# Altium schematic sheet MONO65_A2_s01 [Main page].SchDoc
size A3; DocumentNumber: 1; SheetNumber: 1; SheetTotal: 7
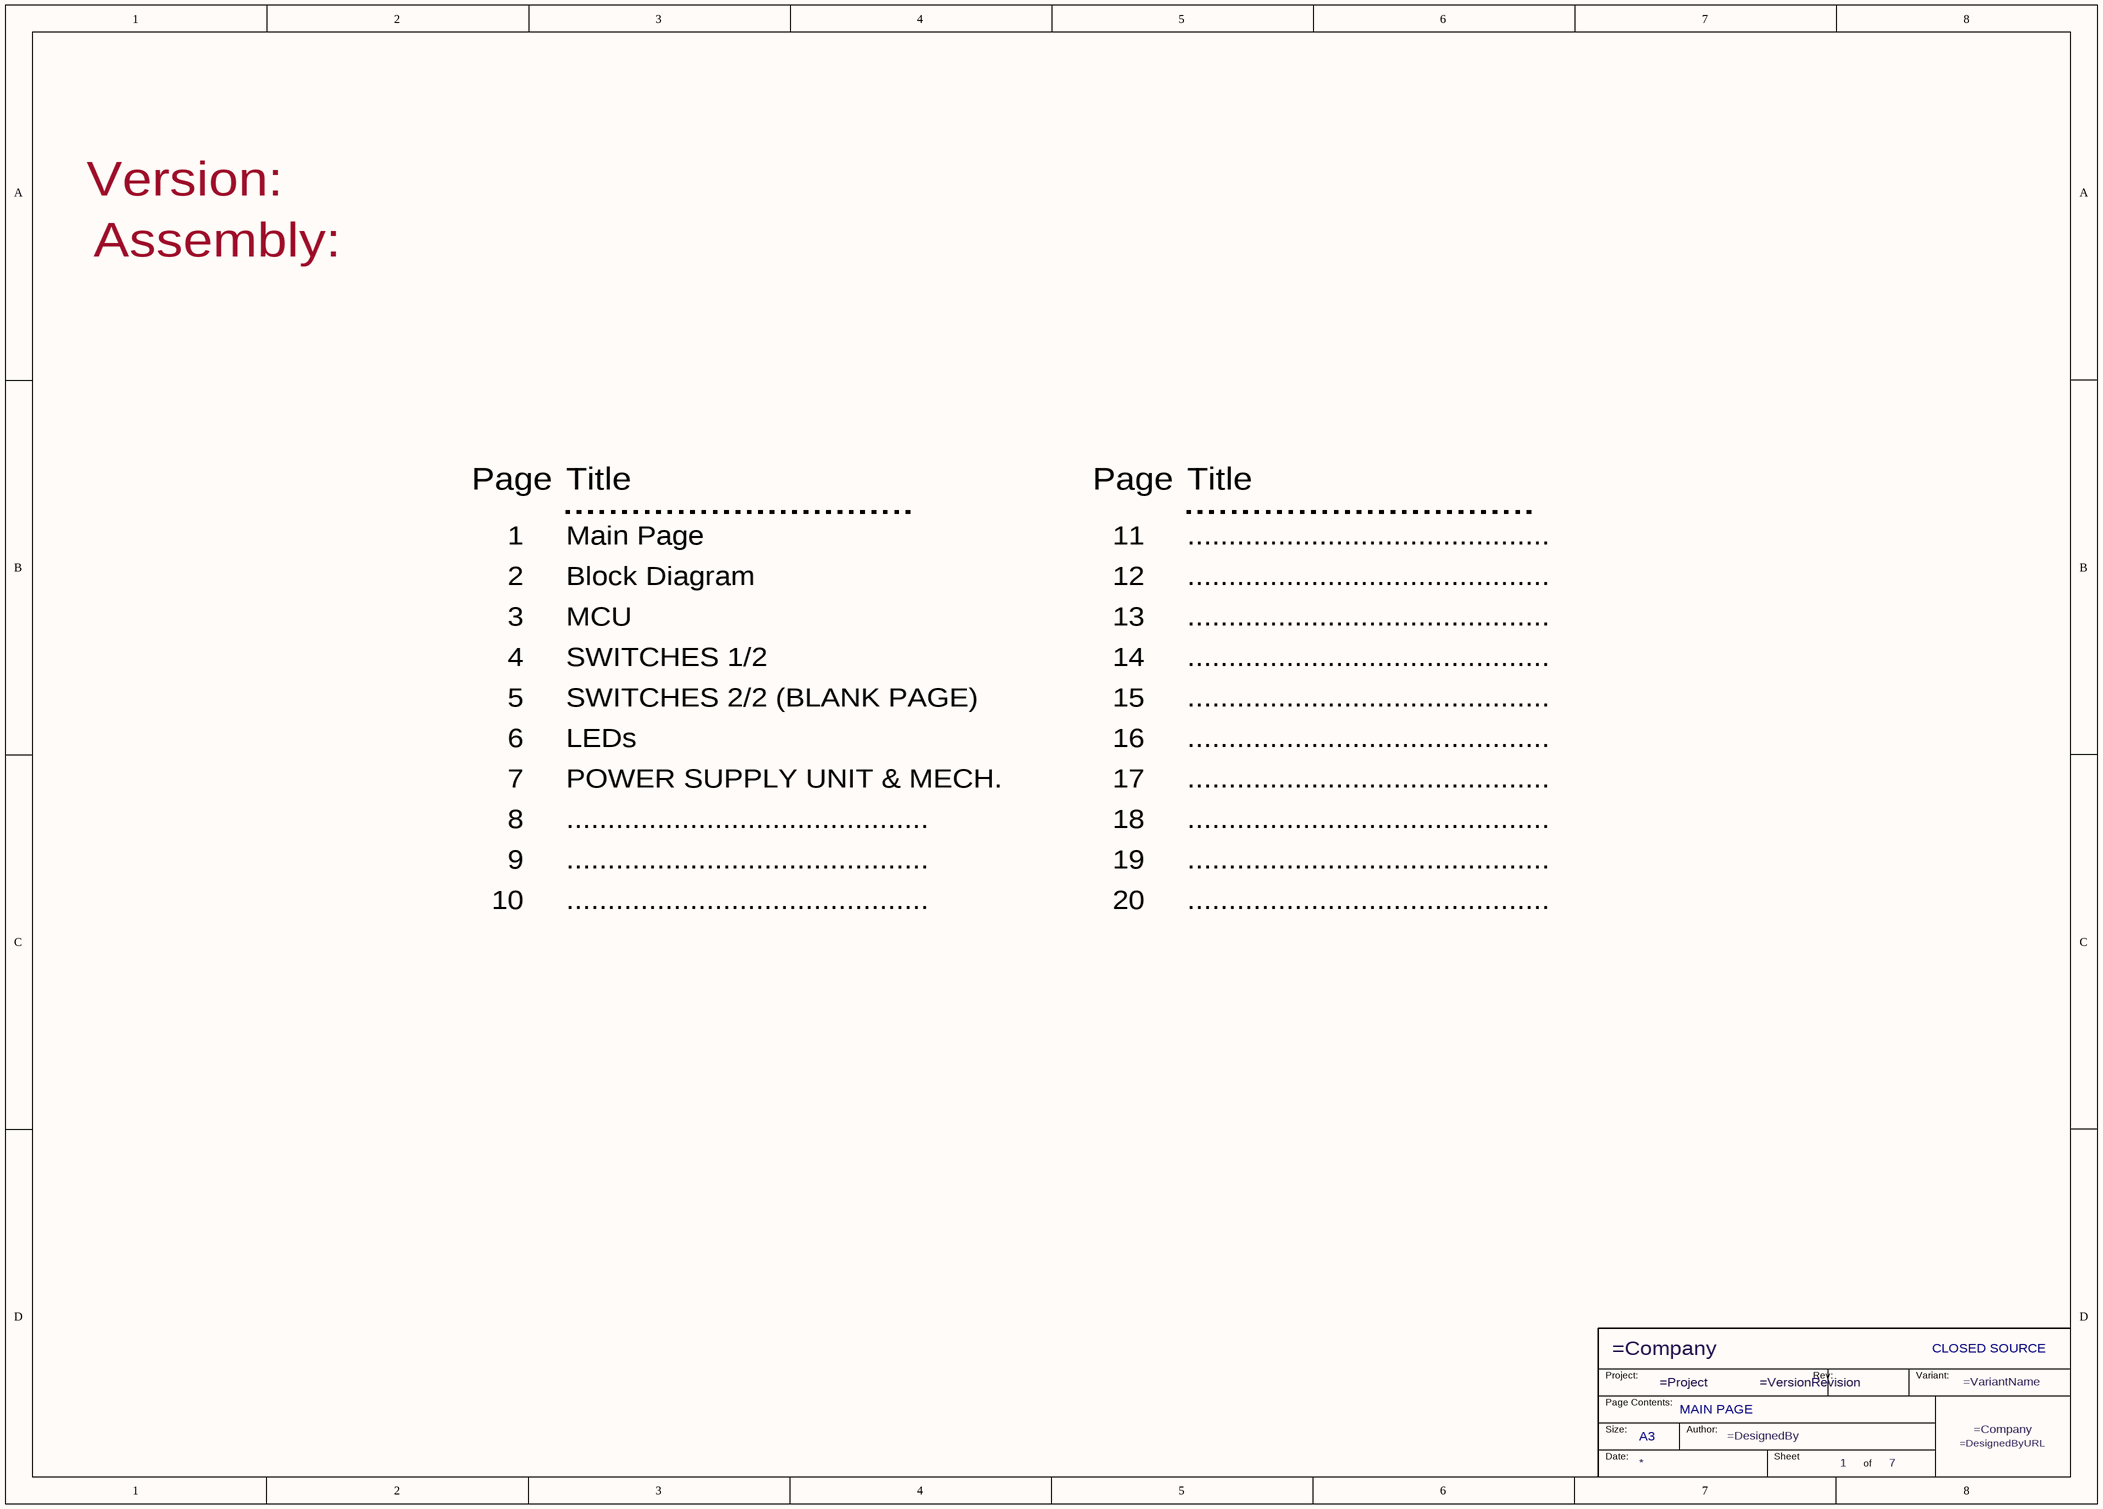
[diagram p0: MONO65_A2_s01 [Main page].SchDoc]

## Parts
TB*  PageContents: MAIN PAGE  Licence: CLOSED SOURCE  Size: A3  (hidden comment: TBL TitleBlock 01)  (graphical)

## Notes on the sheet
- Version:
- Assembly:
- Page
- Title
- 1
- 2
- Main Page
- Block Diagram
- 11
- 12
- ............................................
- 3
- MCU
- 13
- 4
- 5
- SWITCHES 1/2
- SWITCHES 2/2 (BLANK PAGE)
- 14
- 15
- 6
- LEDs
- 16
- 7
- 8
- POWER SUPPLY UNIT & MECH.
- 17
- 18
- 9
- 10
- 19
- 20
- (in symbol TBL TitleBlock 01) Project:; Rev:; Variant:; Page Contents:; Size:; Author:; Date:; Sheet; of

## Library data of the parts
TB* = TBL TitleBlock 01: Custom Title block